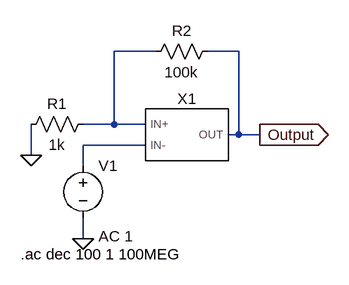
[diagram p0: schematic noninverting-amplifier.asc]
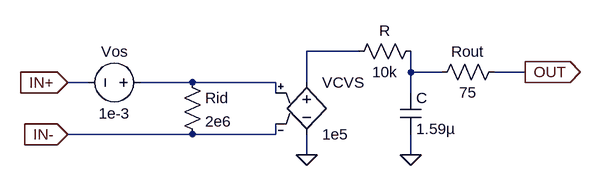
[diagram p1: sub-circuit op-amp.asc]
noninverting-amplifier.asc, the LTspice schematic file:
Version 4.1
SHEET 1 880 680
WIRE 208 48 144 48
WIRE 336 48 288 48
WIRE 144 160 144 48
WIRE 144 160 96 160
WIRE 192 160 144 160
WIRE 336 176 336 48
WIRE 336 176 320 176
WIRE 368 176 336 176
WIRE 192 192 96 192
WIRE 16 208 16 160
WIRE 96 224 96 192
WIRE 96 336 96 304
FLAG 16 208 0
FLAG 96 336 0
FLAG 368 176 Output
IOPIN 368 176 Out
SYMBOL res 112 144 R90
WINDOW 0 0 56 VBottom 2
WINDOW 3 32 56 VTop 2
SYMATTR InstName R1
SYMATTR Value 1k
SYMBOL OP-AMP 256 176 R0
SYMATTR InstName X1
SYMBOL res 304 32 R90
WINDOW 0 0 56 VBottom 2
WINDOW 3 32 56 VTop 2
SYMATTR InstName R2
SYMATTR Value 100k
SYMBOL voltage 96 208 R0
WINDOW 123 24 124 Left 2
WINDOW 39 0 0 Left 0
SYMATTR Value2 AC 1
SYMATTR InstName V1
SYMATTR Value ""
TEXT 0 360 Left 2 !.ac dec 100 1 100MEG

op-amp.asc, the sub-circuit schematic file:
Version 4.1
SHEET 1 892 680
WIRE 528 0 448 0
WIRE 608 32 608 0
WIRE 656 32 608 32
WIRE 784 32 736 32
WIRE 112 48 80 48
WIRE 272 48 192 48
WIRE 400 48 272 48
WIRE 448 48 448 0
WIRE 400 64 400 48
WIRE 608 64 608 32
WIRE 272 128 80 128
WIRE 400 128 400 112
WIRE 400 128 272 128
WIRE 448 160 448 128
WIRE 608 160 608 128
FLAG 80 128 IN-
IOPIN 80 128 In
FLAG 80 48 IN+
IOPIN 80 48 In
FLAG 448 160 0
FLAG 608 160 0
FLAG 784 32 OUT
IOPIN 784 32 Out
SYMBOL voltage 208 48 R90
WINDOW 0 -32 56 VBottom 2
WINDOW 3 32 56 VTop 2
WINDOW 123 0 0 Left 0
WINDOW 39 0 0 Left 0
SYMATTR InstName Vos
SYMATTR Value 1e-3
SYMBOL res 256 32 R0
SYMATTR InstName Rid
SYMATTR Value 2e6
SYMBOL e 448 32 R0
SYMATTR InstName VCVS
SYMATTR Value 1e5
SYMBOL res 624 -16 R90
WINDOW 0 0 56 VBottom 2
WINDOW 3 32 56 VTop 2
SYMATTR InstName R
SYMATTR Value 10k
SYMBOL cap 592 64 R0
SYMATTR InstName C
SYMATTR Value 1.59µ
SYMBOL res 752 16 R90
WINDOW 0 0 56 VBottom 2
WINDOW 3 32 56 VTop 2
SYMATTR InstName Rout
SYMATTR Value 75

The netlist it stands for:
* noninverting-amplifier.asc
R1 N001 0 1k
X§X1 N001 N002 Output op-amp
R2 Output N001 100k
V1 N002 0 AC 1

* block symbol definitions
.subckt op-amp IN+ IN- OUT
Vos N003 IN+ 1e-3
Rid N003 IN- 2e6
E§VCVS N001 0 N003 IN- 1e5
R N002 N001 10k
C N002 0 1.59µ
Rout OUT N002 75
.ends op-amp

.ac dec 100 1 100MEG
.backanno
.end